# Altium schematic sheet FPGA_Bank_IO.SchDoc
size 297 x 209 mm
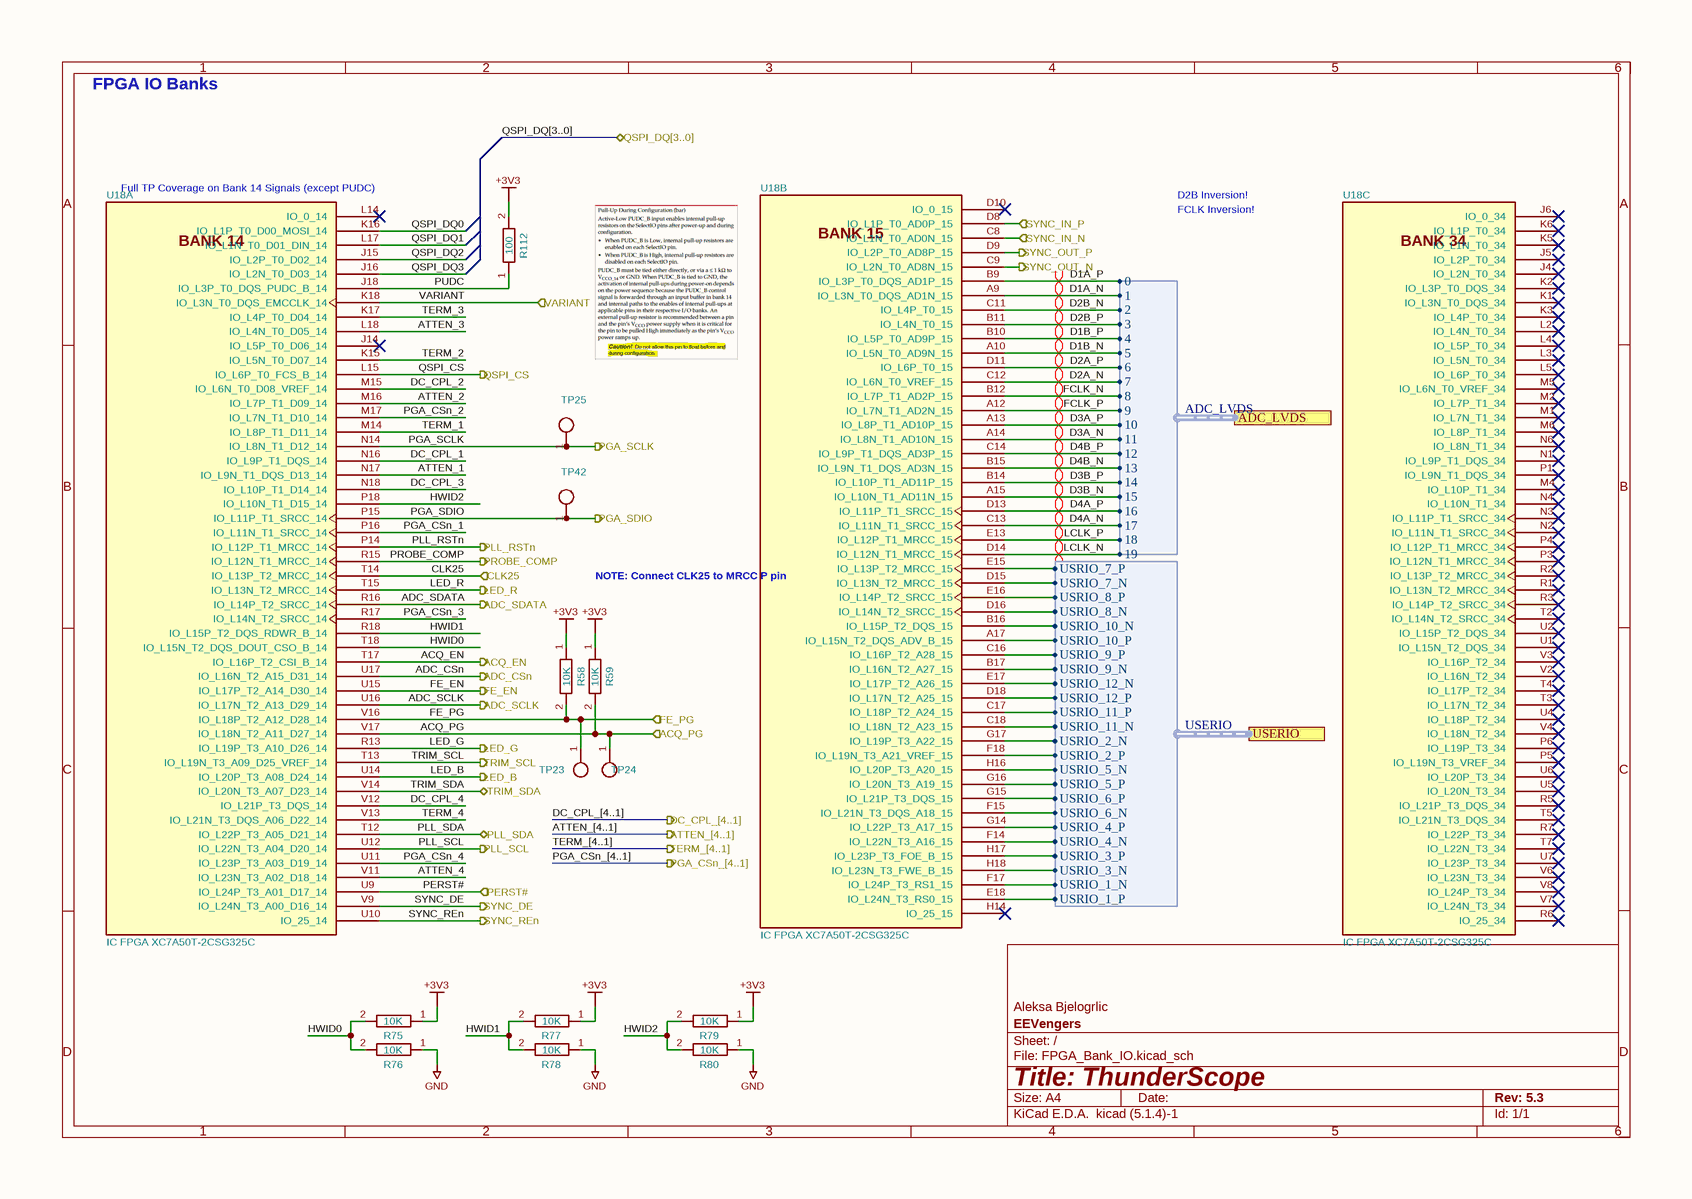
[diagram p0: FPGA_Bank_IO.SchDoc]

## Parts
R58  10K  [GEN_R_0402]
R59  10K  [GEN_R_0402]
R75  10K  [GEN_R_0402]
R76  10K  [GEN_R_0402]
R77  10K  [GEN_R_0402]
R78  10K  [GEN_R_0402]
R79  10K  [GEN_R_0402]
R80  10K  [GEN_R_0402]
R112  100  [GEN_R_0402]
TP23  PCB  [GEN_TP_PCB]  (value not drawn)
TP24  PCB  [GEN_TP_PCB]  (value not drawn)
TP25  PCB  [GEN_TP_PCB]  (value not drawn)
TP42  PCB  [GEN_TP_PCB]  (value not drawn)
U18  IC FPGA XC7A50T-2CSG325C  [XILINX_XC7A50T-2CSG325C]  (parts A,B,C of 9)

## Ports
ACQ_EN (out), ACQ_PG (in), ADC_CSn (out), ADC_LVDS (harness ADC_LVDS), ADC_SCLK (out), ADC_SDATA (out), ATTEN_[4..1] (out), CLK25 (in), DC_CPL_[4..1] (out), FE_EN (out), FE_PG (in), LED_B (out), LED_G (out), LED_R (out), PERST# (in), PGA_CSn_[4..1] (out), PGA_SCLK (out), PGA_SDIO (out), PLL_RSTn (out), PLL_SCL (out), PLL_SDA (bidir), PROBE_COMP (out), QSPI_CS (out), QSPI_DQ[3..0] (bidir), SYNC_DE (out), SYNC_IN_N (in), SYNC_IN_P (in), SYNC_OUT_N (out), SYNC_OUT_P (out), SYNC_REn (out), TERM_[4..1] (out), TRIM_SCL (out), TRIM_SDA (bidir), USERIO (harness USERIO), VARIANT (in)

## Harnesses
USERIO: USRIO_1_P, USRIO_1_N, USRIO_2_P, USRIO_2_N, USRIO_3_P, USRIO_3_N, USRIO_4_P, USRIO_4_N, USRIO_5_P, USRIO_5_N, USRIO_6_P, USRIO_6_N, USRIO_7_P, USRIO_7_N, USRIO_8_P, USRIO_8_N, USRIO_9_P, USRIO_9_N, USRIO_10_P, USRIO_10_N, USRIO_11_P, USRIO_11_N, USRIO_12_P, USRIO_12_N
ADC_LVDS: 0, 1, 2, 3, 4, 5, 6, 7, 8, 9, 10, 11, 12, 13, 14, 15, 16, 17, 18, 19

## Nets
+3V3: R58.1 R59.1 R75.1 R77.1 R79.1 R112.2
GND: R76.1 R78.1 R80.1
ACQ_EN: U18.T17(IO_L16P_T2_CSI_B_14) ; port ACQ_EN
ACQ_PG: R59.2 TP24.1 U18.V17(IO_L18N_T2_A11_D27_14) ; port ACQ_PG
ADC_CSn: U18.U17(IO_L16N_T2_A15_D31_14) ; port ADC_CSn
ADC_SCLK: U18.U16(IO_L17N_T2_A13_D29_14) ; port ADC_SCLK
ADC_SDATA: U18.R16(IO_L14P_T2_SRCC_14) ; port ADC_SDATA
ATTEN_1: U18.N17(IO_L9N_T1_DQS_D13_14)
ATTEN_2: U18.M16(IO_L7P_T1_D09_14)
ATTEN_3: U18.L18(IO_L4N_T0_D05_14)
ATTEN_4: U18.V11(IO_L23N_T3_A02_D18_14)
CLK25: U18.T14(IO_L13P_T2_MRCC_14) ; port CLK25
D1A_N: U18.A9(IO_L3N_T0_DQS_AD1N_15) ; port ADC_LVDS.1
D1A_P: U18.B9(IO_L3P_T0_DQS_AD1P_15) ; port ADC_LVDS.0
D1B_N: U18.A10(IO_L5N_T0_AD9N_15) ; port ADC_LVDS.5
D1B_P: U18.B10(IO_L5P_T0_AD9P_15) ; port ADC_LVDS.4
D2A_N: U18.C12(IO_L6N_T0_VREF_15) ; port ADC_LVDS.7
D2A_P: U18.D11(IO_L6P_T0_15) ; port ADC_LVDS.6
D2B_N: U18.C11(IO_L4P_T0_15) ; port ADC_LVDS.2
D2B_P: U18.B11(IO_L4N_T0_15) ; port ADC_LVDS.3
D3A_N: U18.A14(IO_L8N_T1_AD10N_15) ; port ADC_LVDS.11
D3A_P: U18.A13(IO_L8P_T1_AD10P_15) ; port ADC_LVDS.10
D3B_N: U18.A15(IO_L10N_T1_AD11N_15) ; port ADC_LVDS.15
D3B_P: U18.B14(IO_L10P_T1_AD11P_15) ; port ADC_LVDS.14
D4A_N: U18.C13(IO_L11N_T1_SRCC_15) ; port ADC_LVDS.17
D4A_P: U18.D13(IO_L11P_T1_SRCC_15) ; port ADC_LVDS.16
D4B_N: U18.B15(IO_L9N_T1_DQS_AD3N_15) ; port ADC_LVDS.13
D4B_P: U18.C14(IO_L9P_T1_DQS_AD3P_15) ; port ADC_LVDS.12
DC_CPL_1: U18.N16(IO_L9P_T1_DQS_14)
DC_CPL_2: U18.M15(IO_L6N_T0_D08_VREF_14)
DC_CPL_3: U18.N18(IO_L10P_T1_D14_14)
DC_CPL_4: U18.V12(IO_L21P_T3_DQS_14)
FCLK_N: U18.B12(IO_L7P_T1_AD2P_15) ; port ADC_LVDS.8
FCLK_P: U18.A12(IO_L7N_T1_AD2N_15) ; port ADC_LVDS.9
FE_EN: U18.U15(IO_L17P_T2_A14_D30_14) ; port FE_EN
FE_PG: R58.2 TP23.1 U18.V16(IO_L18P_T2_A12_D28_14) ; port FE_PG
HWID0: R75.2 R76.2 U18.T18(IO_L15N_T2_DQS_DOUT_CSO_B_14)
HWID1: R77.2 R78.2 U18.R18(IO_L15P_T2_DQS_RDWR_B_14)
HWID2: R79.2 R80.2 U18.P18(IO_L10N_T1_D15_14)
LCLK_N: U18.D14(IO_L12N_T1_MRCC_15) ; port ADC_LVDS.19
LCLK_P: U18.E13(IO_L12P_T1_MRCC_15) ; port ADC_LVDS.18
LED_B: U18.U14(IO_L20P_T3_A08_D24_14) ; port LED_B
LED_G: U18.R13(IO_L19P_T3_A10_D26_14) ; port LED_G
LED_R: U18.T15(IO_L13N_T2_MRCC_14) ; port LED_R
PERST#: U18.U9(IO_L24P_T3_A01_D17_14) ; port PERST#
PGA_CSn_1: U18.P16(IO_L11N_T1_SRCC_14)
PGA_CSn_2: U18.M17(IO_L7N_T1_D10_14)
PGA_CSn_3: U18.R17(IO_L14N_T2_SRCC_14)
PGA_CSn_4: U18.U11(IO_L23P_T3_A03_D19_14)
PGA_SCLK: TP25.1 U18.N14(IO_L8N_T1_D12_14) ; port PGA_SCLK
PGA_SDIO: TP42.1 U18.P15(IO_L11P_T1_SRCC_14) ; port PGA_SDIO
PLL_RSTn: U18.P14(IO_L12P_T1_MRCC_14) ; port PLL_RSTn
PLL_SCL: U18.U12(IO_L22N_T3_A04_D20_14) ; port PLL_SCL
PLL_SDA: U18.T12(IO_L22P_T3_A05_D21_14) ; port PLL_SDA
PROBE_COMP: U18.R15(IO_L12N_T1_MRCC_14) ; port PROBE_COMP
PUDC: R112.1 U18.J18(IO_L3P_T0_DQS_PUDC_B_14)
QSPI_CS: U18.L15(IO_L6P_T0_FCS_B_14) ; port QSPI_CS
QSPI_DQ0: U18.K16(IO_L1P_T0_D00_MOSI_14)
QSPI_DQ1: U18.L17(IO_L1N_T0_D01_DIN_14)
QSPI_DQ2: U18.J15(IO_L2P_T0_D02_14)
QSPI_DQ3: U18.J16(IO_L2N_T0_D03_14)
SYNC_DE: U18.V9(IO_L24N_T3_A00_D16_14) ; port SYNC_DE
SYNC_IN_N: U18.C8(IO_L1N_T0_AD0N_15) ; port SYNC_IN_N
SYNC_IN_P: U18.D8(IO_L1P_T0_AD0P_15) ; port SYNC_IN_P
SYNC_OUT_N: U18.C9(IO_L2N_T0_AD8N_15) ; port SYNC_OUT_N
SYNC_OUT_P: U18.D9(IO_L2P_T0_AD8P_15) ; port SYNC_OUT_P
SYNC_REn: U18.U10(IO_25_14) ; port SYNC_REn
TERM_1: U18.M14(IO_L8P_T1_D11_14)
TERM_2: U18.K15(IO_L5N_T0_D07_14)
TERM_3: U18.K17(IO_L4P_T0_D04_14)
TERM_4: U18.V13(IO_L21N_T3_DQS_A06_D22_14)
TRIM_SCL: U18.T13(IO_L19N_T3_A09_D25_VREF_14) ; port TRIM_SCL
TRIM_SDA: U18.V14(IO_L20N_T3_A07_D23_14) ; port TRIM_SDA
VARIANT: U18.K18(IO_L3N_T0_DQS_EMCCLK_14) ; port VARIANT
NetU18_A17: U18.A17(IO_L15N_T2_DQS_ADV_B_15) ; port USERIO.USRIO_10_P
NetU18_B16: U18.B16(IO_L15P_T2_DQS_15) ; port USERIO.USRIO_10_N
NetU18_B17: U18.B17(IO_L16N_T2_A27_15) ; port USERIO.USRIO_9_N
NetU18_C16: U18.C16(IO_L16P_T2_A28_15) ; port USERIO.USRIO_9_P
NetU18_C17: U18.C17(IO_L18P_T2_A24_15) ; port USERIO.USRIO_11_P
NetU18_C18: U18.C18(IO_L18N_T2_A23_15) ; port USERIO.USRIO_11_N
NetU18_D15: U18.D15(IO_L13N_T2_MRCC_15) ; port USERIO.USRIO_7_N
NetU18_D16: U18.D16(IO_L14N_T2_SRCC_15) ; port USERIO.USRIO_8_N
NetU18_D18: U18.D18(IO_L17N_T2_A25_15) ; port USERIO.USRIO_12_P
NetU18_E15: U18.E15(IO_L13P_T2_MRCC_15) ; port USERIO.USRIO_7_P
NetU18_E16: U18.E16(IO_L14P_T2_SRCC_15) ; port USERIO.USRIO_8_P
NetU18_E17: U18.E17(IO_L17P_T2_A26_15) ; port USERIO.USRIO_12_N
NetU18_E18: U18.E18(IO_L24N_T3_RS0_15) ; port USERIO.USRIO_1_P
NetU18_F14: U18.F14(IO_L22N_T3_A16_15) ; port USERIO.USRIO_4_N
NetU18_F15: U18.F15(IO_L21N_T3_DQS_A18_15) ; port USERIO.USRIO_6_N
NetU18_F17: U18.F17(IO_L24P_T3_RS1_15) ; port USERIO.USRIO_1_N
NetU18_F18: U18.F18(IO_L19N_T3_A21_VREF_15) ; port USERIO.USRIO_2_P
NetU18_G14: U18.G14(IO_L22P_T3_A17_15) ; port USERIO.USRIO_4_P
NetU18_G15: U18.G15(IO_L21P_T3_DQS_15) ; port USERIO.USRIO_6_P
NetU18_G16: U18.G16(IO_L20N_T3_A19_15) ; port USERIO.USRIO_5_P
NetU18_G17: U18.G17(IO_L19P_T3_A22_15) ; port USERIO.USRIO_2_N
NetU18_H16: U18.H16(IO_L20P_T3_A20_15) ; port USERIO.USRIO_5_N
NetU18_H17: U18.H17(IO_L23P_T3_FOE_B_15) ; port USERIO.USRIO_3_P
NetU18_H18: U18.H18(IO_L23N_T3_FWE_B_15) ; port USERIO.USRIO_3_N

Not connected (* = marked no-connect by the designer): U18 D10(IO_0_15)* H14(IO_25_15)* J4(IO_L2N_T0_34)* J5(IO_L2P_T0_34)* J6(IO_0_34)* J14(IO_L5P_T0_D06_14)* K1(IO_L3N_T0_DQS_34)* K2(IO_L3P_T0_DQS_34)* K3(IO_L4P_T0_34)* K5(IO_L1N_T0_34)* K6(IO_L1P_T0_34)* L2(IO_L4N_T0_34)* L3(IO_L5N_T0_34)* L4(IO_L5P_T0_34)* L5(IO_L6P_T0_34)* L14(IO_0_14)* M1(IO_L7N_T1_34)* M2(IO_L7P_T1_34)* M4(IO_L10P_T1_34)* M5(IO_L6N_T0_VREF_34)* M6(IO_L8P_T1_34)* N1(IO_L9P_T1_DQS_34)* N2(IO_L11N_T1_SRCC_34)* N3(IO_L11P_T1_SRCC_34)* N4(IO_L10N_T1_34)* N6(IO_L8N_T1_34)* P1(IO_L9N_T1_DQS_34)* P3(IO_L12N_T1_MRCC_34)* P4(IO_L12P_T1_MRCC_34)* P5(IO_L19N_T3_VREF_34)* P6(IO_L19P_T3_34)* R1(IO_L13N_T2_MRCC_34)* R2(IO_L13P_T2_MRCC_34)* R3(IO_L14P_T2_SRCC_34)* R5(IO_L21P_T3_DQS_34)* R6(IO_25_34)* R7(IO_L22P_T3_34)* T2(IO_L14N_T2_SRCC_34)* T3(IO_L17N_T2_34)* T4(IO_L17P_T2_34)* T5(IO_L21N_T3_DQS_34)* T7(IO_L22N_T3_34)* U1(IO_L15N_T2_DQS_34)* U2(IO_L15P_T2_DQS_34)* U4(IO_L18P_T2_34)* U5(IO_L20N_T3_34)* U6(IO_L20P_T3_34)* U7(IO_L23P_T3_34)* V2(IO_L16N_T2_34)* V3(IO_L16P_T2_34)* V4(IO_L18N_T2_34)* V6(IO_L23N_T3_34)* V7(IO_L24N_T3_34)* V8(IO_L24P_T3_34)*

## Buses and harness runs
bus ATTEN_[4..1] = port ATTEN_[4..1]
bus DC_CPL_[4..1] = port DC_CPL_[4..1]
bus PGA_CSn_[4..1] = port PGA_CSn_[4..1]
bus QSPI_DQ[3..0] = port QSPI_DQ[3..0]
bus TERM_[4..1] = port TERM_[4..1]

## Layout directives
differential pair; differential pair class 100Z_Diff: D1A_N, D1A_P, D1B_N, D1B_P, D2A_N, D2A_P, D2B_N, D2B_P, D3A_N, D3A_P, D3B_N, D3B_P, D4A_N, D4A_P, D4B_N, D4B_P, FCLK_N, FCLK_P, LCLK_N, LCLK_P

## Notes on the sheet
- FPGA IO Banks
- (near U18) Full TP Coverage on Bank 14 Signals (except PUDC)
- FCLK Inversion!
- D2B Inversion!
- NOTE: Connect CLK25 to MRCC P pin
- 1
- 2
- 3
- 4
- 5
- 6
- A
- B
- C
- Aleksa Bjelogrlic
- D
- Title: ThunderScope
- File: FPGA_Bank_IO.kicad_sch
- Sheet: /
- EEVengers
- KiCad E.D.A.  kicad (5.1.4)-1
- Size: A4
- Date:
- Rev: 5.3
- Id: 1/1
- (in symbol IC FPGA XC7A50T-2CSG325C, part A) BANK 14
- (in symbol IC FPGA XC7A50T-2CSG325C, part B) BANK 15
- (in symbol IC FPGA XC7A50T-2CSG325C, part C) BANK 34

## Library data of the parts
R58 R59 R75-R80 = RES 10K OHM 1% 1/16W 0402: MANUFACTURER: Yageo; MANUFACTURER PART NUMBER: RC0402FR-0710KL; TOLERANCE: 1%; Substitutions Policy: Any Parametric Equivalent; PACKAGE: 0402; SUPPLIER 1: Mouser; SUPPLIER PART NUMBER 1: 603-RC0402FR-0710KL; Footprint: Thunderscope_Rev5:GEN_R_0402; Value: 10K
R112 = RES 100 OHM 1% 1/10W 0402: MANUFACTURER: Yageo; MANUFACTURER PART NUMBER: RC0402FR-07100RL; TOLERANCE: 1%; Substitutions Policy: Any Parametric Equivalent; PACKAGE: 0402; SUPPLIER 1: Mouser; SUPPLIER PART NUMBER 1: 603-RC0402FR-07100RL; Footprint: Thunderscope_Rev5:GEN_R_0402; Value: 100
TP23-TP25 TP42 = TP PCB 1mm: Footprint: Thunderscope_Rev5:GEN_TP_PCB; Value: PCB
U18 = IC FPGA XC7A50T-2CSG325C: MANUFACTURER: Xilinx; Substitutions Policy: No Substitutions; HOUSE PART NUMBER: XC7A50T-2CSG325C; MANUFACTURER PART NUMBER: XC7A50T-2CSG325C; SUPPLIER 1: Digi-Key; SUPPLIER PART NUMBER 1: 122-2193-ND; PACKAGE: 324-BGA (15x15mm); Value: IC FPGA XC7A50T-2CSG325C; Footprint: Thunderscope_Rev5:XILINX_XC7A50T-2CSG325C